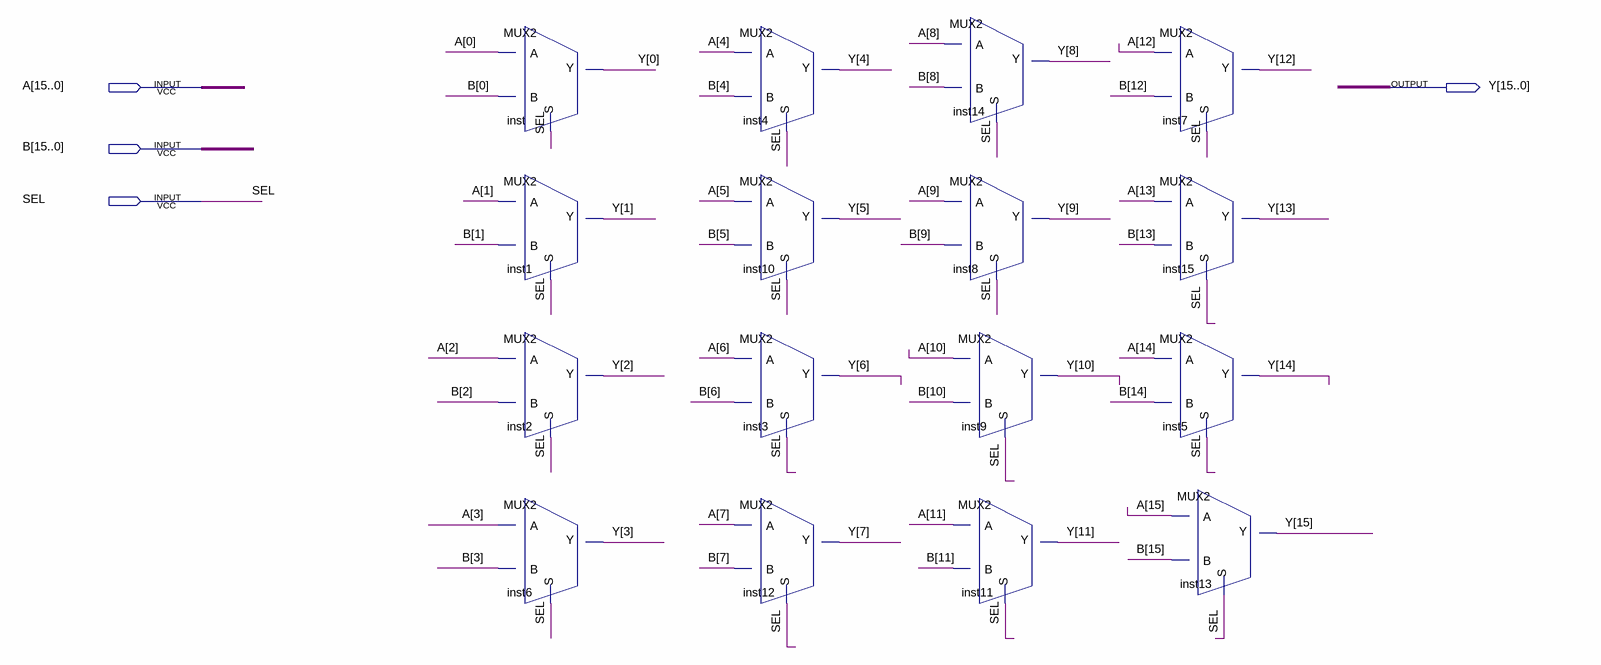
[diagram p0: schematic sheet]
// Quartus schematic MUX2_1-16BIT.bdf as structural Verilog: 16 symbols, 4 pins
module \MUX2_1-16BIT  (
  input  [15:0] A,
  input  [15:0] B,
  input  SEL,
  output [15:0] Y
);

  MUX2 inst (.A(A[0]), .B(B[0]), .S(SEL), .Y(Y[0]));
  MUX2 inst1 (.A(A[1]), .B(B[1]), .S(SEL), .Y(Y[1]));
  MUX2 inst2 (.A(A[2]), .B(B[2]), .S(SEL), .Y(Y[2]));
  MUX2 inst6 (.A(A[3]), .B(B[3]), .S(SEL), .Y(Y[3]));
  MUX2 inst4 (.A(A[4]), .B(B[4]), .S(SEL), .Y(Y[4]));
  MUX2 inst10 (.A(A[5]), .B(B[5]), .S(SEL), .Y(Y[5]));
  MUX2 inst3 (.A(A[6]), .B(B[6]), .S(SEL), .Y(Y[6]));
  MUX2 inst12 (.A(A[7]), .B(B[7]), .S(SEL), .Y(Y[7]));
  MUX2 inst14 (.A(A[8]), .B(B[8]), .S(SEL), .Y(Y[8]));
  MUX2 inst8 (.A(A[9]), .B(B[9]), .S(SEL), .Y(Y[9]));
  MUX2 inst9 (.A(A[10]), .B(B[10]), .S(SEL), .Y(Y[10]));
  MUX2 inst11 (.A(A[11]), .B(B[11]), .S(SEL), .Y(Y[11]));
  MUX2 inst7 (.A(A[12]), .B(B[12]), .S(SEL), .Y(Y[12]));
  MUX2 inst15 (.A(A[13]), .B(B[13]), .S(SEL), .Y(Y[13]));
  MUX2 inst5 (.A(A[14]), .B(B[14]), .S(SEL), .Y(Y[14]));
  MUX2 inst13 (.A(A[15]), .B(B[15]), .S(SEL), .Y(Y[15]));
endmodule
